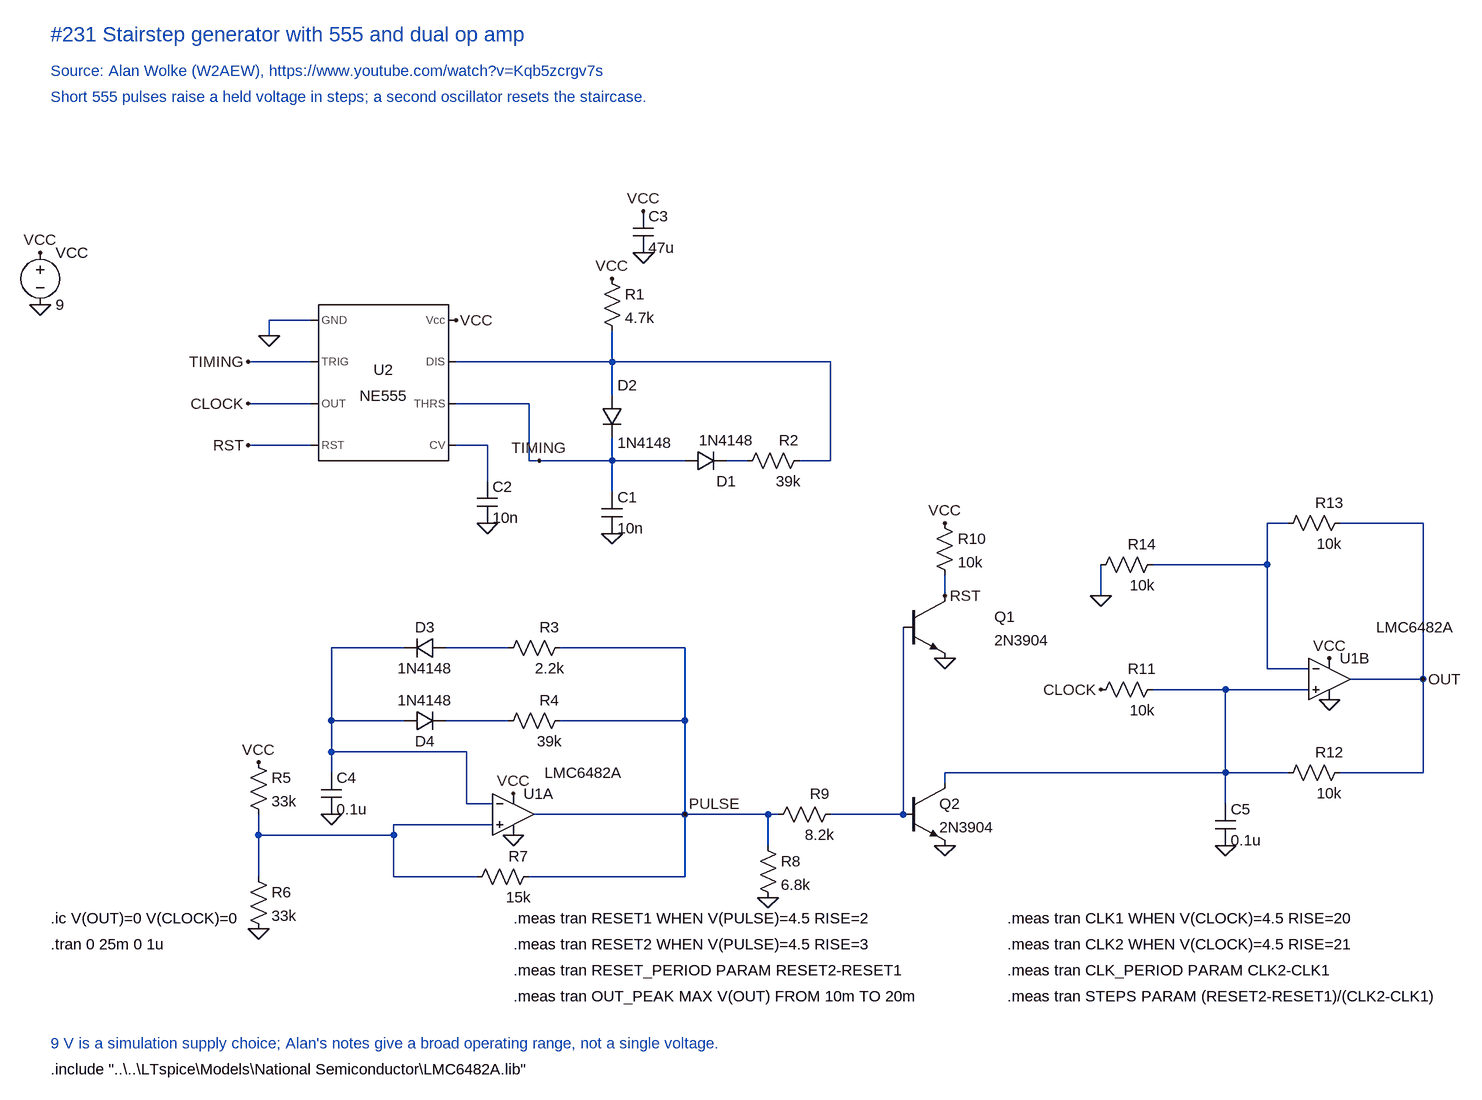
[diagram p0: schematic Stairstep generator.asc]
Stairstep generator.asc, the LTspice schematic file:
Version 4
SHEET 1 2200 1400
SYMBOL voltage -928 -16 R0
SYMATTR InstName VCC
SYMATTR Value 9
FLAG -928 0 VCC
FLAG -928 80 0
SYMBOL Misc\NE555 -400 200 R0
SYMATTR InstName U2
SYMATTR Value NE555
WIRE -512 104 -576 104
WIRE -576 104 -576 128
FLAG -576 128 0
WIRE -512 232 -608 232
FLAG -608 232 CLOCK
WIRE -512 296 -608 296
FLAG -608 296 RST
FLAG -288 104 VCC
SYMBOL res -64 24 R0
SYMATTR InstName R1
SYMATTR Value 4.7k
FLAG -48 40 VCC
WIRE -48 120 -48 168
WIRE -288 168 -48 168
WIRE -48 168 -48 220
SYMBOL diode -64 220 R0
WINDOW 0 24 -16 Left 2
WINDOW 3 24 72 Left 2
SYMATTR InstName D2
SYMATTR Value 1N4148
WIRE -48 284 -48 320
WIRE -512 168 -608 168
FLAG -608 168 TIMING
WIRE -288 232 -176 232
WIRE -176 232 -176 320
WIRE -176 320 -48 320
FLAG -160 320 TIMING
SYMBOL cap -64 368 R0
SYMATTR InstName C1
SYMATTR Value 10n
WIRE -48 320 -48 368
FLAG -48 432 0
SYMBOL diode 64 336 R270
WINDOW 0 0 64 VBottom 2
WINDOW 3 32 64 VTop 2
SYMATTR InstName D1
SYMATTR Value 1N4148
WIRE -48 320 64 320
SYMBOL res 256 304 R90
WINDOW 0 0 32 VBottom 2
WINDOW 3 32 32 VTop 2
SYMATTR InstName R2
SYMATTR Value 39k
WIRE 128 320 160 320
WIRE 240 320 288 320
WIRE 288 320 288 168
WIRE -48 168 288 168
SYMBOL cap -256 352 R0
SYMATTR InstName C2
SYMATTR Value 10n
WIRE -288 296 -240 296
WIRE -240 296 -240 352
FLAG -240 416 0
SYMBOL cap -16 -64 R0
SYMATTR InstName C3
SYMATTR Value 47u
FLAG 0 -64 VCC
FLAG 0 0 0
SYMBOL OpAmps\opamp2 -200 800 R0
WINDOW 3 48 0 Left 2
SYMATTR InstName U1A
SYMATTR Value LMC6482A
FLAG -200 832 VCC
FLAG -200 896 0
SYMBOL cap -496 800 R0
SYMATTR InstName C4
SYMATTR Value 0.1u
FLAG -480 864 0
WIRE -480 608 -480 800
WIRE -480 768 -272 768
WIRE -272 768 -272 848
WIRE -272 848 -232 848
SYMBOL diode -304 592 R90
WINDOW 0 0 32 VBottom 2
WINDOW 3 32 32 VTop 2
SYMATTR InstName D3
SYMATTR Value 1N4148
WIRE -480 608 -368 608
SYMBOL res -112 592 R90
WINDOW 0 0 32 VBottom 2
WINDOW 3 32 32 VTop 2
SYMATTR InstName R3
SYMATTR Value 2.2k
WIRE -304 608 -208 608
WIRE -128 608 64 608
SYMBOL diode -368 736 R270
WINDOW 0 0 32 VBottom 2
WINDOW 3 32 32 VTop 2
SYMATTR InstName D4
SYMATTR Value 1N4148
WIRE -480 720 -368 720
SYMBOL res -112 704 R90
WINDOW 0 0 32 VBottom 2
WINDOW 3 32 32 VTop 2
SYMATTR InstName R4
SYMATTR Value 39k
WIRE -304 720 -208 720
WIRE -128 720 64 720
WIRE 64 608 64 864
WIRE -168 864 64 864
FLAG 64 864 PULSE
SYMBOL res -608 768 R0
SYMATTR InstName R5
SYMATTR Value 33k
FLAG -592 784 VCC
WIRE -592 864 -592 896
SYMBOL res -608 944 R0
SYMATTR InstName R6
SYMATTR Value 33k
WIRE -592 896 -592 960
FLAG -592 1040 0
WIRE -592 896 -384 896
WIRE -384 880 -384 896
WIRE -384 880 -232 880
SYMBOL res -160 944 R90
WINDOW 0 0 32 VBottom 2
WINDOW 3 32 32 VTop 2
SYMATTR InstName R7
SYMATTR Value 15k
WIRE -384 896 -384 960
WIRE -384 960 -256 960
WIRE -176 960 64 960
WIRE 64 864 64 960
SYMBOL res 176 896 R0
SYMATTR InstName R8
SYMATTR Value 6.8k
WIRE 64 864 192 864
WIRE 192 864 192 912
FLAG 192 992 0
SYMBOL res 304 848 R90
WINDOW 0 0 32 VBottom 2
WINDOW 3 32 32 VTop 2
SYMATTR InstName R9
SYMATTR Value 8.2k
WIRE 64 864 208 864
WIRE 288 864 400 864
SYMBOL npn 400 528 R0
WINDOW 0 140 32 Left 2
WINDOW 3 140 68 Left 2
SYMATTR InstName Q1
SYMATTR Value 2N3904
SYMBOL npn 400 816 R0
SYMATTR InstName Q2
SYMATTR Value 2N3904
WIRE 400 576 400 864
FLAG 464 624 0
FLAG 464 912 0
SYMBOL res 448 400 R0
SYMATTR InstName R10
SYMATTR Value 10k
FLAG 464 416 VCC
WIRE 464 496 464 528
FLAG 464 528 RST
SYMBOL OpAmps\opamp2 1056 592 R0
WINDOW 3 72 -16 Left 2
SYMATTR InstName U1B
SYMATTR Value LMC6482A
FLAG 1056 624 VCC
FLAG 1056 688 0
SYMBOL res 800 656 R90
WINDOW 0 0 32 VBottom 2
WINDOW 3 32 32 VTop 2
SYMATTR InstName R11
SYMATTR Value 10k
FLAG 704 672 CLOCK
WIRE 784 672 1024 672
WIRE 464 816 464 800
WIRE 464 800 896 800
WIRE 896 672 896 848
SYMBOL cap 880 848 R0
SYMATTR InstName C5
SYMATTR Value 0.1u
FLAG 896 912 0
SYMBOL res 1088 784 R90
WINDOW 0 0 32 VBottom 2
WINDOW 3 32 32 VTop 2
SYMATTR InstName R12
SYMATTR Value 10k
WIRE 896 800 992 800
WIRE 1072 800 1200 800
WIRE 1088 656 1200 656
WIRE 1200 416 1200 800
FLAG 1200 656 OUT
SYMBOL res 1088 400 R90
WINDOW 0 0 32 VBottom 2
WINDOW 3 32 32 VTop 2
SYMATTR InstName R13
SYMATTR Value 10k
WIRE 960 416 992 416
WIRE 1072 416 1200 416
WIRE 960 416 960 640
WIRE 960 640 1024 640
SYMBOL res 800 464 R90
WINDOW 0 0 32 VBottom 2
WINDOW 3 32 32 VTop 2
SYMATTR InstName R14
SYMATTR Value 10k
WIRE 704 480 704 528
FLAG 704 528 0
WIRE 784 480 960 480
TEXT -912 -336 Left 3 ;#231 Stairstep generator with 555 and dual op amp
TEXT -912 -280 Left 2 ;Source: Alan Wolke (W2AEW), https://www.youtube.com/watch?v=Kqb5zcrgv7s
TEXT -912 -240 Left 2 ;Short 555 pulses raise a held voltage in steps; a second oscillator resets the staircase.
TEXT -912 1024 Left 2 !.ic V(OUT)=0 V(CLOCK)=0
TEXT -912 1064 Left 2 !.tran 0 25m 0 1u
TEXT -200 1024 Left 2 !.meas tran RESET1 WHEN V(PULSE)=4.5 RISE=2
TEXT -200 1064 Left 2 !.meas tran RESET2 WHEN V(PULSE)=4.5 RISE=3
TEXT -200 1104 Left 2 !.meas tran RESET_PERIOD PARAM RESET2-RESET1
TEXT -200 1144 Left 2 !.meas tran OUT_PEAK MAX V(OUT) FROM 10m TO 20m
TEXT 560 1024 Left 2 !.meas tran CLK1 WHEN V(CLOCK)=4.5 RISE=20
TEXT 560 1064 Left 2 !.meas tran CLK2 WHEN V(CLOCK)=4.5 RISE=21
TEXT 560 1104 Left 2 !.meas tran CLK_PERIOD PARAM CLK2-CLK1
TEXT 560 1144 Left 2 !.meas tran STEPS PARAM (RESET2-RESET1)/(CLK2-CLK1)
TEXT -912 1216 Left 2 ;9 V is a simulation supply choice; Alan's notes give a broad operating range, not a single voltage.
TEXT -912 1256 Left 2 !.include "..\..\LTspice\Models\National Semiconductor\LMC6482A.lib"

The netlist it stands for:
* Stairstep generator.asc
VCC VCC 0 9
XU2 0 TIMING CLOCK RST N003 TIMING N001 VCC NE555  ; pins GND TRIG OUT RST CV THRS DIS Vcc
R1 VCC N001 4.7k
D2 N001 TIMING 1N4148
C1 TIMING 0 10n
D1 TIMING N002 1N4148
R2 N001 N002 39k
C2 N003 0 10n
C3 VCC 0 47u
XU1A N007 N004 VCC 0 PULSE LMC6482A  ; pins In+ In- V+ V- OUT
C4 N004 0 0.1u
D3 N005 N004 1N4148
R3 PULSE N005 2.2k
D4 N004 N006 1N4148
R4 PULSE N006 39k
R5 VCC N007 33k
R6 N007 0 33k
R7 PULSE N007 15k
R8 PULSE 0 6.8k
R9 N008 PULSE 8.2k
Q1 RST N008 0 0 2N3904
Q2 N009 N008 0 0 2N3904
R10 VCC RST 10k
XU1B N009 N010 VCC 0 OUT LMC6482A  ; pins In+ In- V+ V- OUT
R11 N009 CLOCK 10k
C5 N009 0 0.1u
R12 OUT N009 10k
R13 OUT N010 10k
R14 N010 0 10k
.model D D
.lib standard.dio
.model NPN NPN
.model PNP PNP
.lib standard.bjt
* #231 Stairstep generator with 555 and dual op amp
* Source: Alan Wolke (W2AEW), https://www.youtube.com/watch?v=Kqb5zcrgv7s
* Short 555 pulses raise a held voltage in steps; a second oscillator resets the staircase.
.ic V(OUT)=0 V(CLOCK)=0
.tran 0 25m 0 1u
.meas tran RESET1 WHEN V(PULSE)=4.5 RISE=2
.meas tran RESET2 WHEN V(PULSE)=4.5 RISE=3
.meas tran RESET_PERIOD PARAM RESET2-RESET1
.meas tran OUT_PEAK MAX V(OUT) FROM 10m TO 20m
.meas tran CLK1 WHEN V(CLOCK)=4.5 RISE=20
.meas tran CLK2 WHEN V(CLOCK)=4.5 RISE=21
.meas tran CLK_PERIOD PARAM CLK2-CLK1
.meas tran STEPS PARAM (RESET2-RESET1)/(CLK2-CLK1)
* 9 V is a simulation supply choice; Alan's notes give a broad operating range, not a single voltage.
.include "..\..\LTspice\Models\National Semiconductor\LMC6482A.lib"
.lib NE555.sub
.backanno
.end